# Altium schematic sheet giris_guc.SchDoc: ATAKAN
size A4; Revision: ASD; Time: Flyback - Giris
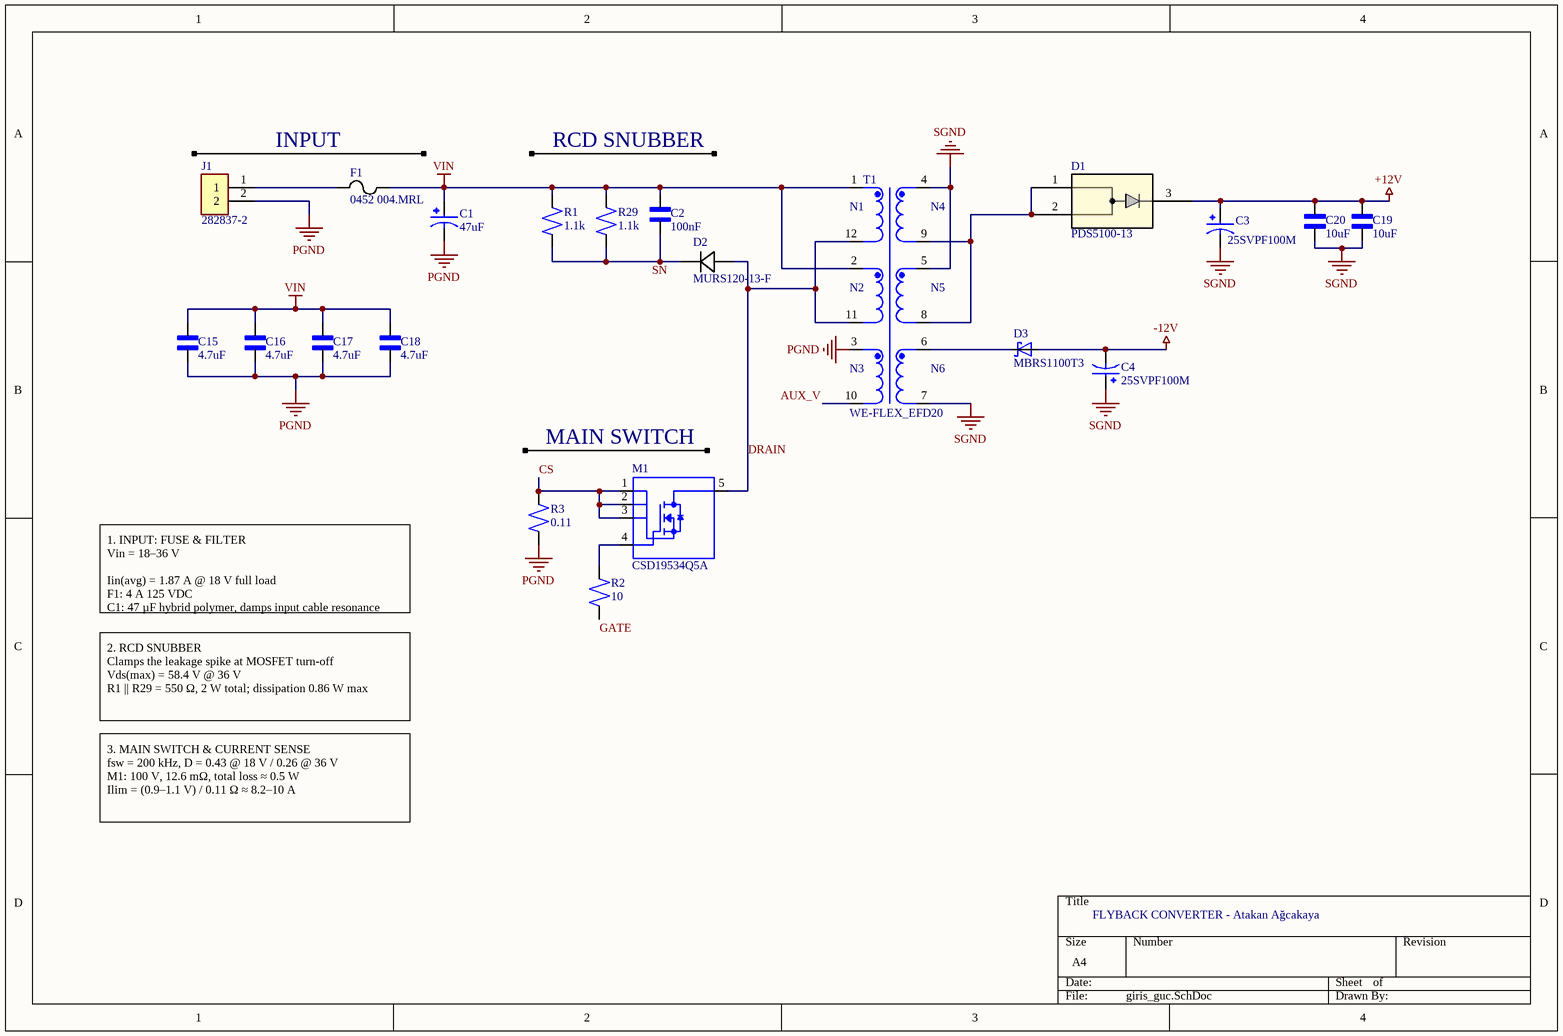
[diagram p0: giris_guc.SchDoc]

## Parts
C1  47uF  [CAP_EEHZA1J470P]
C2  100nF  [CAPC3216X180N]
C3  25SVPF100M  [CAP_25SVPF100M]
C4  25SVPF100M  [CAP_25SVPF100M]
C15  4.7uF  [CAPC3225X280N]
C16  4.7uF  [CAPC3225X280N]
C17  4.7uF  [CAPC3225X280N]
C18  4.7uF  [CAPC3225X280N]
C19  10uF  [CAPC3225X280N]
C20  10uF  [CAPC3225X280N]
D1  PDS5100-13  [PDS5100_DIO]
D2  MURS120-13-F  [SMB_DIO]
D3  MBRS1100T3  [SMB]
F1  0452 004.MRL  [FUS_LITTELFUSE_0452_LTF]
J1  282837-2  [TE_282837-2]
M1  CSD19534Q5A  [TRANS_CSD19534Q5A]
R1  1.1k  [RESC6432X65N]
R2  10  [RESC2012X60N]
R3  0.11  [RESC6432X65N]
R29  1.1k  [RESC6432X65N]
T1  WE-FLEX_EFD20  [WE-FLEX_EFD20]

## Nets
+12V: C3.1 C19.2 C20.2 D1.3
-12V: C4.2 D3.A
PGND: C1.2 C15.1 C16.1 C17.1 C18.1 J1.2 R3.1 T1.3
SGND: C3.2 C4.1 C19.1 C20.1 T1.4 T1.5 T1.7
VIN: C1.1 C2.2 C15.2 C16.2 C17.2 C18.2 F1.2 R1.2 R29.2 T1.1 T1.2
AUX_V: T1.10
CS: M1.1(S_1) M1.2(S_2) M1.3(S_3) R3.2
DRAIN: D2.2 M1.5(D) T1.11 T1.12
GATE: R2.1
SN: C2.1 D2.1 R1.1 R29.1
NetD1_1: D1.1 D1.2 T1.8 T1.9
NetD3_C: D3.C T1.6
NetF1_1: F1.1 J1.1
NetM1_4: M1.4(G) R2.2

## Notes on the sheet
- INPUT
- RCD SNUBBER
- MAIN SWITCH
- 1. INPUT: FUSE & FILTER
  Vin = 18–36 V
  Iin(avg) = 1.87 A @ 18 V full load
  F1: 4 A 125 VDC
  C1: 47 µF hybrid polymer, damps input cable resonance
- 2. RCD SNUBBER
  Clamps the leakage spike at MOSFET turn-off
  Vds(max) = 58.4 V @ 36 V
  R1 || R29 = 550 Ω, 2 W total; dissipation 0.86 W max
- 3. MAIN SWITCH & CURRENT SENSE
  fsw = 200 kHz, D = 0.43 @ 18 V / 0.26 @ 36 V
  M1: 100 V, 12.6 mΩ, total loss ≈ 0.5 W
  Ilim = (0.9–1.1 V) / 0.11 Ω ≈ 8.2–10 A
- FLYBACK CONVERTER - Atakan Ağcakaya
- (in symbol WE-FLEX_EFD20) N1; N4; N2; N5; N3; N6

## Library data of the parts
C1 = EEHZA1J470P: EEHZA1J470P / 47F 63V Aluminum - Polymer Capacitors Radial, Can - SMD 40mOhm 10000 Hrs @ 105C; MF: Panasonic; Package: RADIAL-2 Panasonic; Price: None; Check_prices: https://www.snapeda.com/parts/EEHZA1J470P/Panasonic/view-part/?ref=eda; Value: *; SnapEDA_Link: https://www.snapeda.com/parts/EEHZA1J470P/Panasonic/view-part/?ref=snap; MP: EEHZA1J470P; Availability: In Stock; Purchase-URL: https://pricing.snapeda.com/search?q=EEHZA1J470P&ref=eda
C2 = C_1206: 100nF, 100V, X7R; Value: 100nF
C3 C4 = 25SVPF100M: CAP, ALU ELEC, POLYMER, 100UF, 25V, SMD; Capacitance: 100ÂµF; Voltage(DC): 25V; Capacitor Case / Package: Radial Can - SMD; ESR: 0.024ohm; Lifetime @ Temperature: 5000 hours; MF: Panasonic; MP: 25SVPF100M.; SnapEDA_Link: https://www.snapeda.com/parts/25SVPF100M./Panasonic/view-part/?ref=snap; Package: None; Value: *; Check_prices: https://www.snapeda.com/parts/25SVPF100M./Panasonic/view-part/?ref=eda
C15-C18 = C_1210: Murata GRM32ER72A475KE14L / 4.7µF, 100V, X7R; Value: 4.7uF
C19 C20 = C_1210: 10µF, 25V; Value: 10uF
D1 = PDS5100-13: 100V, 5A Schottky, AEC-Q101; Manufacturer_Name: Diodes Inc; Copyright: Copyright (C) 2026 Ultra Librarian. All rights reserved.; Manufacturer_Part_Number: PDS5100-13; RefDes: RefDes; Type: Type
D2 = MURS120-13-F: 200V, 1A, ultra hızl; Manufacturer_Name: Diodes Inc; Copyright: Copyright (C) 2025 Ultra Librarian. All rights reserved.; Manufacturer_Part_Number: MURS120-13-F
D3 = MBRS1100T3: 1.0 A, 100 V, Schottky Power Rectifier, Surface Mount; MANUFACTURER: ON Semiconductor; Package: SMB-2 ON Semiconductor; MPN: MBRS1100T3; DATASHEET_URL: https://www.onsemi.com/pub/Collateral/MBRS1100T3-D.PDF; Value: *; SOURCE_URL: https://www.snapeda.com/parts/MBRS1100T3/Onsemi/view-part/
F1 = 0452 003.MRL: Littelfuse 0452004.MRL; Manufacturer_Name: Littelfuse Inc; Copyright: Copyright (C) 2025 Ultra Librarian. All rights reserved.; Manufacturer_Part_Number: 0452 003.MRL
J1 = 282837-2: Terminal Block Connector Wire Receptacle 2 5.08 mm 30-16 AWG Green 13.5 A 250 V | TE Connectivity 282837-2; SnapEDA_Link: https://www.snapeda.com/parts/282837-2/TE+Connectivity+AMP+Connectors/view-part/?ref=snap; Price: None; Check_prices: https://www.snapeda.com/parts/282837-2/TE+Connectivity+AMP+Connectors/view-part/?ref=eda; Purchase-URL: https://pricing.snapeda.com/search/part/282837-2/?ref=eda; MF: TE Connectivity; MP: 282837-2; Value: *; Availability: In Stock; Package: None
M1 = CSD19534Q5A: 100V, N ch NexFET MOSFET, single SON5x6, 15.1mOhm 8-VSONP -55 to 150; MF: Texas Instruments; Mouser-Purchase-URL: https://snapeda.com/shop?store=Mouser&id=485742; Package: VSONP-8 Texas Instruments; Texas_Instruments-Purchase-URL: https://snapeda.com/shop?store=Texas+Instruments&id=485742; Value: *; Price: None; DigiKey-Purchase-URL: https://snapeda.com/shop?store=DigiKey&id=485742; MP: CSD19534Q5A; SnapEDA_Link: https://www.snapeda.com/parts/CSD19534Q5A/Texas%20Instruments/view-part/485742/?ref=snap; Availability: Good
R1 R29 = R_2512: Yageo RC2512FK-071K1L / 1.1kΩ, 1W; Value: 1.1k
R2 = R_0805: Value: 10
R3 = R_2512: Yageo PT2512FK-7W0R11L / 0.11Ω, %1, 2W, AEC-Q200; Value: 0.11
T1 = WE-FLEX_EFD20: Flexible For Configurable (For DC/DC) SMPS Transformer 500VDC Isolation Surface Mount; MF: WÃ¼rth Elektronik; MP: 749196521; SnapEDA_Link: https://www.snapeda.com/parts/749196521/W%25C3%25BCrth+Elektronik+Midcom/view-part/?ref=snap; Package: None; Value: *; Check_prices: https://www.snapeda.com/parts/749196521/W%25C3%25BCrth+Elektronik+Midcom/view-part/?ref=eda